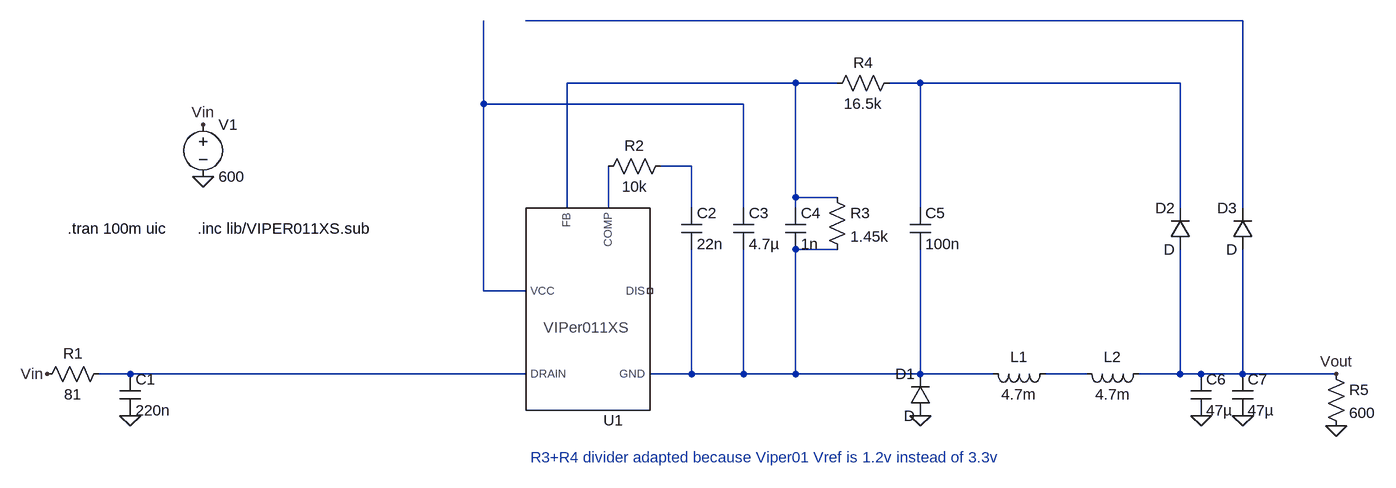
[diagram p0: schematic vi.asc]
vi.asc, the LTspice schematic file:
Version 4
SHEET 1 2340 680
WIRE 2128 -720 1024 -720
WIRE 1440 -624 1088 -624
WIRE 1504 -624 1440 -624
WIRE 1632 -624 1584 -624
WIRE 2032 -624 1632 -624
WIRE 960 -592 960 -720
WIRE 1360 -592 960 -592
WIRE 1280 -496 1232 -496
WIRE 1440 -448 1440 -624
WIRE 1504 -448 1440 -448
WIRE 1088 -432 1088 -624
WIRE 1152 -432 1152 -496
WIRE 1280 -432 1280 -496
WIRE 1360 -432 1360 -592
WIRE 1440 -432 1440 -448
WIRE 1632 -432 1632 -624
WIRE 2032 -432 2032 -624
WIRE 2128 -432 2128 -720
WIRE 1504 -368 1440 -368
WIRE 960 -304 960 -592
WIRE 1024 -304 960 -304
WIRE 416 -176 368 -176
WIRE 1024 -176 416 -176
WIRE 1280 -176 1280 -368
WIRE 1280 -176 1216 -176
WIRE 1360 -176 1360 -368
WIRE 1360 -176 1280 -176
WIRE 1440 -176 1440 -368
WIRE 1440 -176 1360 -176
WIRE 1632 -176 1632 -368
WIRE 1632 -176 1440 -176
WIRE 1744 -176 1632 -176
WIRE 1888 -176 1824 -176
WIRE 2032 -176 2032 -368
WIRE 2032 -176 1968 -176
WIRE 2064 -176 2032 -176
WIRE 2128 -176 2128 -368
WIRE 2128 -176 2064 -176
WIRE 2272 -176 2128 -176
FLAG 528 -480 0
FLAG 528 -560 Vin
FLAG 288 -176 Vin
FLAG 416 -112 0
FLAG 1632 -112 0
FLAG 2064 -112 0
FLAG 2128 -112 0
FLAG 2272 -96 0
FLAG 2272 -176 Vout
SYMBOL voltage 528 -576 R0
WINDOW 123 0 0 Left 0
WINDOW 39 0 0 Left 0
SYMATTR InstName V1
SYMATTR Value 600
SYMBOL res 384 -192 R90
WINDOW 0 0 56 VBottom 2
WINDOW 3 32 56 VTop 2
SYMATTR InstName R1
SYMATTR Value 81
SYMBOL cap 400 -176 R0
SYMATTR InstName C1
SYMATTR Value 220n
SYMBOL res 1136 -480 R270
WINDOW 0 32 56 VTop 2
WINDOW 3 0 56 VBottom 2
SYMATTR InstName R2
SYMATTR Value 10k
SYMBOL cap 1264 -432 R0
SYMATTR InstName C2
SYMATTR Value 22n
SYMBOL cap 1344 -432 R0
SYMATTR InstName C3
SYMATTR Value 4.7µ
SYMBOL cap 1424 -432 R0
SYMATTR InstName C4
SYMATTR Value 1n
SYMBOL res 1488 -464 R0
SYMATTR InstName R3
SYMATTR Value 1.45k
SYMBOL diode 1648 -112 R180
WINDOW 0 24 64 Left 2
WINDOW 3 24 0 Left 2
SYMATTR InstName D1
SYMBOL cap 1616 -432 R0
SYMATTR InstName C5
SYMATTR Value 100n
SYMBOL res 1600 -640 R90
WINDOW 0 0 56 VBottom 2
WINDOW 3 32 56 VTop 2
SYMATTR InstName R4
SYMATTR Value 16.5k
SYMBOL ind 1840 -192 R90
WINDOW 0 5 56 VBottom 2
WINDOW 3 32 56 VTop 2
SYMATTR InstName L1
SYMATTR Value 4.7m
SYMATTR SpiceLine Rser=1m
SYMBOL ind 1984 -192 R90
WINDOW 0 5 56 VBottom 2
WINDOW 3 32 56 VTop 2
SYMATTR InstName L2
SYMATTR Value 4.7m
SYMATTR SpiceLine Rser=1m
SYMBOL diode 2048 -368 R180
WINDOW 0 24 64 Left 2
WINDOW 3 24 0 Left 2
SYMATTR InstName D2
SYMBOL cap 2048 -176 R0
SYMATTR InstName C6
SYMATTR Value 47µ
SYMBOL cap 2112 -176 R0
SYMATTR InstName C7
SYMATTR Value 47µ
SYMBOL res 2256 -192 R0
SYMATTR InstName R5
SYMATTR Value 600
SYMBOL VIPER011XS 1168 -224 R180
SYMATTR InstName U1
SYMBOL diode 2144 -368 R180
WINDOW 0 24 64 Left 2
WINDOW 3 24 0 Left 2
SYMATTR InstName D3
TEXT 520 -400 Left 2 !.inc lib/VIPER011XS.sub
TEXT 320 -400 Left 2 !.tran 100m uic
TEXT 1032 -48 Left 2 ;R3+R4 divider adapted because Viper01 Vref is 1.2v instead of 3.3v

The netlist it stands for:
* vi.asc
V1 Vin 0 600
R1 N008 Vin 81
C1 N008 0 220n
R2 N006 N005 10k
C2 N005 N007 22n
C3 N004 N007 4.7µ
C4 N002 N007 1n
R3 N002 N007 1.45k
D1 0 N007 D
C5 N003 N007 100n
R4 N003 N002 16.5k
L1 N009 N007 4.7m Rser=1m
L2 Vout N009 4.7m Rser=1m
D2 Vout N003 D
C6 Vout 0 47µ
C7 Vout 0 47µ
R5 Vout 0 600
XU1 N006 NC_01 N008 N002 N007 N004 VIPER011XS  ; pins COMP DIS DRAIN FB GND VCC
D3 Vout N001 D
.model D D
.lib standard.dio
.inc lib/VIPER011XS.sub
.tran 100m uic
* R3+R4 divider adapted because Viper01 Vref is 1.2v instead of 3.3v
.lib lib/VIPER011XS.SUB
.backanno
.end